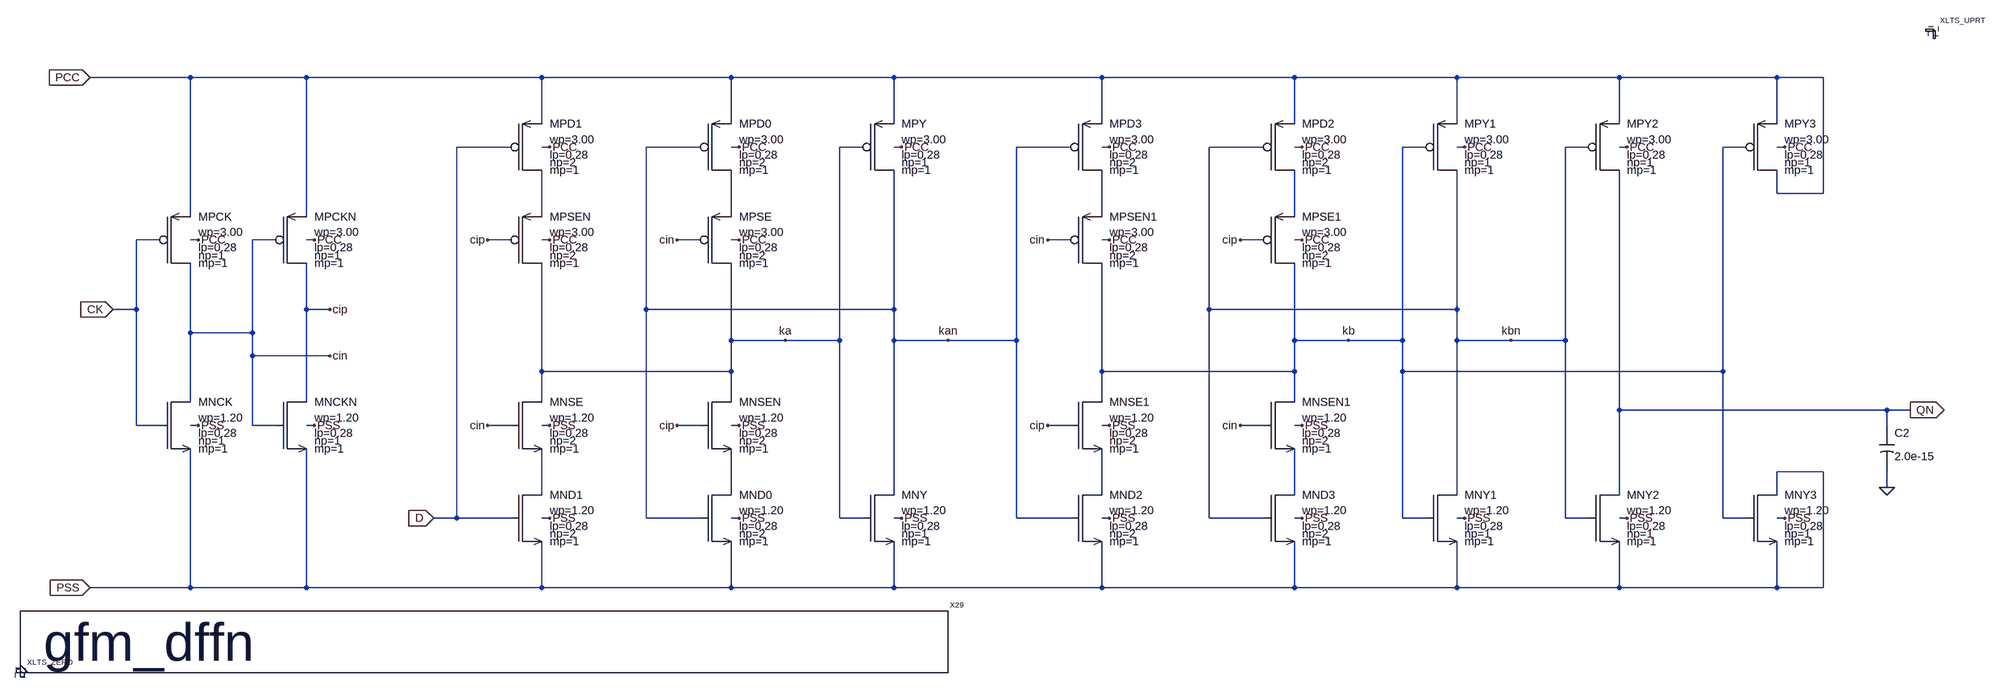
[diagram p0: schematic gfm_dffn.asc]
gfm_dffn.asc, the LTspice schematic file:
Version 4
SHEET 1 4876 4336
WIRE 352 -1232 144 -1232
WIRE 592 -1232 352 -1232
WIRE 1232 -1232 592 -1232
WIRE 1632 -1232 1232 -1232
WIRE 1968 -1232 1632 -1232
WIRE 2768 -1232 1968 -1232
WIRE 3168 -1232 2768 -1232
WIRE 3504 -1232 3168 -1232
WIRE 3840 -1232 3504 -1232
WIRE 4176 -1232 3840 -1232
WIRE 4272 -1232 4176 -1232
WIRE 1232 -1136 1232 -1232
WIRE 1632 -1136 1632 -1232
WIRE 1968 -1136 1968 -1232
WIRE 2768 -1136 2768 -1232
WIRE 3168 -1136 3168 -1232
WIRE 3504 -1136 3504 -1232
WIRE 3840 -1136 3840 -1232
WIRE 4176 -1136 4176 -1232
WIRE 1168 -1088 1056 -1088
WIRE 1248 -1088 1232 -1088
WIRE 1568 -1088 1456 -1088
WIRE 1648 -1088 1632 -1088
WIRE 1904 -1088 1856 -1088
WIRE 1984 -1088 1968 -1088
WIRE 2704 -1088 2592 -1088
WIRE 2784 -1088 2768 -1088
WIRE 3104 -1088 2992 -1088
WIRE 3184 -1088 3168 -1088
WIRE 3440 -1088 3392 -1088
WIRE 3520 -1088 3504 -1088
WIRE 3776 -1088 3728 -1088
WIRE 3856 -1088 3840 -1088
WIRE 4112 -1088 4064 -1088
WIRE 4192 -1088 4176 -1088
WIRE 4176 -992 4176 -1040
WIRE 4272 -992 4272 -1232
WIRE 4272 -992 4176 -992
WIRE 352 -944 352 -1232
WIRE 592 -944 592 -1232
WIRE 1232 -944 1232 -1040
WIRE 1632 -944 1632 -1040
WIRE 2768 -944 2768 -1040
WIRE 3168 -944 3168 -1040
WIRE 288 -896 240 -896
WIRE 368 -896 352 -896
WIRE 528 -896 480 -896
WIRE 608 -896 592 -896
WIRE 1168 -896 1120 -896
WIRE 1248 -896 1232 -896
WIRE 1568 -896 1520 -896
WIRE 1648 -896 1632 -896
WIRE 2704 -896 2656 -896
WIRE 2784 -896 2768 -896
WIRE 3104 -896 3056 -896
WIRE 3184 -896 3168 -896
WIRE 240 -752 240 -896
WIRE 240 -752 192 -752
WIRE 592 -752 592 -848
WIRE 640 -752 592 -752
WIRE 1456 -752 1456 -1088
WIRE 1968 -752 1968 -1040
WIRE 1968 -752 1456 -752
WIRE 2992 -752 2992 -1088
WIRE 3504 -752 3504 -1040
WIRE 3504 -752 2992 -752
WIRE 352 -704 352 -848
WIRE 480 -704 480 -896
WIRE 480 -704 352 -704
WIRE 1632 -688 1632 -848
WIRE 1744 -688 1632 -688
WIRE 1856 -688 1856 -1088
WIRE 1856 -688 1744 -688
WIRE 1968 -688 1968 -752
WIRE 2080 -688 1968 -688
WIRE 2592 -688 2592 -1088
WIRE 2592 -688 2080 -688
WIRE 3168 -688 3168 -848
WIRE 3280 -688 3168 -688
WIRE 3392 -688 3392 -1088
WIRE 3392 -688 3280 -688
WIRE 3504 -688 3504 -752
WIRE 3616 -688 3504 -688
WIRE 3728 -688 3728 -1088
WIRE 3728 -688 3616 -688
WIRE 480 -656 480 -704
WIRE 640 -656 480 -656
WIRE 1232 -624 1232 -848
WIRE 1632 -624 1632 -688
WIRE 1632 -624 1232 -624
WIRE 2768 -624 2768 -848
WIRE 3168 -624 3168 -688
WIRE 3168 -624 2768 -624
WIRE 3392 -624 3392 -688
WIRE 4064 -624 4064 -1088
WIRE 4064 -624 3392 -624
WIRE 352 -560 352 -704
WIRE 592 -560 592 -752
WIRE 1232 -560 1232 -624
WIRE 1632 -560 1632 -624
WIRE 2768 -560 2768 -624
WIRE 3168 -560 3168 -624
WIRE 3840 -544 3840 -1040
WIRE 4560 -544 3840 -544
WIRE 4608 -544 4560 -544
WIRE 240 -512 240 -752
WIRE 288 -512 240 -512
WIRE 368 -512 352 -512
WIRE 480 -512 480 -656
WIRE 528 -512 480 -512
WIRE 608 -512 592 -512
WIRE 1168 -512 1120 -512
WIRE 1248 -512 1232 -512
WIRE 1568 -512 1520 -512
WIRE 1648 -512 1632 -512
WIRE 2704 -512 2656 -512
WIRE 2784 -512 2768 -512
WIRE 3104 -512 3056 -512
WIRE 3184 -512 3168 -512
WIRE 4560 -512 4560 -544
WIRE 4272 -416 4176 -416
WIRE 4560 -384 4560 -416
WIRE 1232 -368 1232 -464
WIRE 1632 -368 1632 -464
WIRE 1968 -368 1968 -688
WIRE 2768 -368 2768 -464
WIRE 3168 -368 3168 -464
WIRE 3504 -368 3504 -688
WIRE 3840 -368 3840 -544
WIRE 4176 -368 4176 -416
WIRE 1056 -320 1056 -1088
WIRE 1056 -320 1008 -320
WIRE 1168 -320 1056 -320
WIRE 1248 -320 1232 -320
WIRE 1456 -320 1456 -752
WIRE 1568 -320 1456 -320
WIRE 1648 -320 1632 -320
WIRE 1856 -320 1856 -688
WIRE 1904 -320 1856 -320
WIRE 1984 -320 1968 -320
WIRE 2592 -320 2592 -688
WIRE 2704 -320 2592 -320
WIRE 2784 -320 2768 -320
WIRE 2992 -320 2992 -752
WIRE 3104 -320 2992 -320
WIRE 3184 -320 3168 -320
WIRE 3392 -320 3392 -624
WIRE 3440 -320 3392 -320
WIRE 3520 -320 3504 -320
WIRE 3728 -320 3728 -688
WIRE 3776 -320 3728 -320
WIRE 3856 -320 3840 -320
WIRE 4064 -320 4064 -624
WIRE 4112 -320 4064 -320
WIRE 4192 -320 4176 -320
WIRE 352 -176 352 -464
WIRE 352 -176 144 -176
WIRE 592 -176 592 -464
WIRE 592 -176 352 -176
WIRE 1232 -176 1232 -272
WIRE 1232 -176 592 -176
WIRE 1632 -176 1632 -272
WIRE 1632 -176 1232 -176
WIRE 1968 -176 1968 -272
WIRE 1968 -176 1632 -176
WIRE 2768 -176 2768 -272
WIRE 2768 -176 1968 -176
WIRE 3168 -176 3168 -272
WIRE 3168 -176 2768 -176
WIRE 3504 -176 3504 -272
WIRE 3504 -176 3168 -176
WIRE 3840 -176 3840 -272
WIRE 3840 -176 3504 -176
WIRE 4176 -176 4176 -272
WIRE 4176 -176 3840 -176
WIRE 4272 -176 4272 -416
WIRE 4272 -176 4176 -176
FLAG 144 -176 PSS
IOPIN 144 -176 In
FLAG 144 -1232 PCC
IOPIN 144 -1232 In
FLAG 192 -752 CK
IOPIN 192 -752 In
FLAG 1008 -320 D
IOPIN 1008 -320 In
FLAG 1648 -512 PSS
FLAG 1520 -512 cip
FLAG 1248 -512 PSS
FLAG 1120 -512 cin
FLAG 1648 -896 PCC
FLAG 1520 -896 cin
FLAG 1248 -896 PCC
FLAG 1120 -896 cip
FLAG 1648 -1088 PCC
FLAG 1248 -1088 PCC
FLAG 1648 -320 PSS
FLAG 1248 -320 PSS
FLAG 368 -512 PSS
FLAG 368 -896 PCC
FLAG 608 -512 PSS
FLAG 608 -896 PCC
FLAG 640 -752 cip
FLAG 640 -656 cin
FLAG 1984 -1088 PCC
FLAG 1984 -320 PSS
FLAG 1744 -688 ka
FLAG 4608 -544 QN
IOPIN 4608 -544 Out
FLAG 4560 -384 0
FLAG 3184 -512 PSS
FLAG 3056 -512 cin
FLAG 2784 -512 PSS
FLAG 2656 -512 cip
FLAG 3184 -896 PCC
FLAG 3056 -896 cip
FLAG 2784 -896 PCC
FLAG 2656 -896 cin
FLAG 3184 -1088 PCC
FLAG 2784 -1088 PCC
FLAG 3184 -320 PSS
FLAG 2784 -320 PSS
FLAG 3520 -1088 PCC
FLAG 3520 -320 PSS
FLAG 3280 -688 kb
FLAG 2080 -688 kan
FLAG 3856 -1088 PCC
FLAG 3856 -320 PSS
FLAG 4192 -1088 PCC
FLAG 4192 -320 PSS
FLAG 3616 -688 kbn
SYMBOL gfmcu_nmos3p3 1168 -512 R0
SYMATTR InstName MNSE
SYMATTR SpiceLine np=2
SYMATTR Value wp=1.20
SYMATTR Value2 lp=0.28
SYMBOL gfmcu_nmos3p3 1168 -320 R0
SYMATTR InstName MND1
SYMATTR SpiceLine np=2
SYMATTR Value wp=1.20
SYMATTR Value2 lp=0.28
SYMBOL gfmcu_pmos3p3 1568 -896 R0
SYMATTR InstName MPSE
SYMATTR SpiceLine np=2
SYMATTR Value wp=3.00
SYMATTR Value2 lp=0.28
SYMBOL gfmcu_pmos3p3 1568 -1088 R0
SYMATTR InstName MPD0
SYMATTR SpiceLine np=2
SYMATTR Value wp=3.00
SYMATTR Value2 lp=0.28
SYMBOL gfmcu_pmos3p3 1168 -896 R0
SYMATTR InstName MPSEN
SYMATTR SpiceLine np=2
SYMATTR Value wp=3.00
SYMATTR Value2 lp=0.28
SYMBOL gfmcu_pmos3p3 1168 -1088 R0
SYMATTR InstName MPD1
SYMATTR SpiceLine np=2
SYMATTR Value wp=3.00
SYMATTR Value2 lp=0.28
SYMBOL BD_GTitleLTS 0 0 R0
SYMATTR InstName X29
SYMATTR SpiceModel gfm_dffn
SYMBOL gfmcu_nmos3p3 1568 -512 R0
SYMATTR InstName MNSEN
SYMATTR SpiceLine np=2
SYMATTR Value wp=1.20
SYMATTR Value2 lp=0.28
SYMBOL gfmcu_nmos3p3 1568 -320 R0
SYMATTR InstName MND0
SYMATTR SpiceLine np=2
SYMATTR Value wp=1.20
SYMATTR Value2 lp=0.28
SYMBOL gfmcu_nmos3p3 288 -512 R0
SYMATTR InstName MNCK
SYMATTR Value wp=1.20
SYMATTR Value2 lp=0.28
SYMBOL gfmcu_pmos3p3 288 -896 R0
SYMATTR InstName MPCK
SYMATTR Value wp=3.00
SYMATTR Value2 lp=0.28
SYMBOL gfmcu_nmos3p3 528 -512 R0
SYMATTR InstName MNCKN
SYMATTR Value wp=1.20
SYMATTR Value2 lp=0.28
SYMBOL gfmcu_pmos3p3 528 -896 R0
SYMATTR InstName MPCKN
SYMATTR Value wp=3.00
SYMATTR Value2 lp=0.28
SYMBOL gfmcu_pmos3p3 1904 -1088 R0
SYMATTR InstName MPY
SYMATTR Value wp=3.00
SYMATTR Value2 lp=0.28
SYMBOL gfmcu_nmos3p3 1904 -320 R0
SYMATTR InstName MNY
SYMATTR Value wp=1.20
SYMATTR Value2 lp=0.28
SYMBOL gfmcu_nmos3p3 2704 -512 R0
SYMATTR InstName MNSE1
SYMATTR SpiceLine np=2
SYMATTR Value wp=1.20
SYMATTR Value2 lp=0.28
SYMBOL gfmcu_nmos3p3 2704 -320 R0
SYMATTR InstName MND2
SYMATTR SpiceLine np=2
SYMATTR Value wp=1.20
SYMATTR Value2 lp=0.28
SYMBOL gcap 4560 -512 R0
SYMATTR InstName C2
SYMATTR Value 2.0e-15
SYMBOL gfmcu_pmos3p3 3104 -896 R0
SYMATTR InstName MPSE1
SYMATTR SpiceLine np=2
SYMATTR Value wp=3.00
SYMATTR Value2 lp=0.28
SYMBOL gfmcu_pmos3p3 3104 -1088 R0
SYMATTR InstName MPD2
SYMATTR SpiceLine np=2
SYMATTR Value wp=3.00
SYMATTR Value2 lp=0.28
SYMBOL gfmcu_pmos3p3 2704 -896 R0
SYMATTR InstName MPSEN1
SYMATTR SpiceLine np=2
SYMATTR Value wp=3.00
SYMATTR Value2 lp=0.28
SYMBOL gfmcu_pmos3p3 2704 -1088 R0
SYMATTR InstName MPD3
SYMATTR SpiceLine np=2
SYMATTR Value wp=3.00
SYMATTR Value2 lp=0.28
SYMBOL gfmcu_nmos3p3 3104 -512 R0
SYMATTR InstName MNSEN1
SYMATTR SpiceLine np=2
SYMATTR Value wp=1.20
SYMATTR Value2 lp=0.28
SYMBOL gfmcu_nmos3p3 3104 -320 R0
SYMATTR InstName MND3
SYMATTR SpiceLine np=2
SYMATTR Value wp=1.20
SYMATTR Value2 lp=0.28
SYMBOL gfmcu_pmos3p3 3440 -1088 R0
SYMATTR InstName MPY1
SYMATTR Value wp=3.00
SYMATTR Value2 lp=0.28
SYMBOL gfmcu_nmos3p3 3440 -320 R0
SYMATTR InstName MNY1
SYMATTR Value wp=1.20
SYMATTR Value2 lp=0.28
SYMBOL gfmcu_pmos3p3 3776 -1088 R0
SYMATTR InstName MPY2
SYMATTR Value wp=3.00
SYMATTR Value2 lp=0.28
SYMBOL gfmcu_nmos3p3 3776 -320 R0
SYMATTR InstName MNY2
SYMATTR Value wp=1.20
SYMATTR Value2 lp=0.28
SYMBOL gfmcu_pmos3p3 4112 -1088 R0
SYMATTR InstName MPY3
SYMATTR Value wp=3.00
SYMATTR Value2 lp=0.28
SYMBOL gfmcu_nmos3p3 4112 -320 R0
SYMATTR InstName MNY3
SYMATTR Value wp=1.20
SYMATTR Value2 lp=0.28
SYMBOL BD_ZERO 0 0 R0
SYMATTR InstName XLTS_ZERO
SYMBOL BD_UPRT 4656 -1328 R0
SYMATTR InstName XLTS_UPRT

The netlist it stands for:
* gfm_dffn.asc
XMNSE ka cin N005 PSS gfmcu_nmos3p3 wp=1.20 lp=0.28 np=2 mp=1  ; pins ND NG NS NB
XMND1 N005 D PSS PSS gfmcu_nmos3p3 wp=1.20 lp=0.28 np=2 mp=1  ; pins ND NG NS NB
XMPSE ka cin N002 PCC gfmcu_pmos3p3 wp=3.00 lp=0.28 np=2 mp=1  ; pins ND NG NS NB
XMPD0 N002 kan PCC PCC gfmcu_pmos3p3 wp=3.00 lp=0.28 np=2 mp=1  ; pins ND NG NS NB
XMPSEN ka cip N001 PCC gfmcu_pmos3p3 wp=3.00 lp=0.28 np=2 mp=1  ; pins ND NG NS NB
XMPD1 N001 D PCC PCC gfmcu_pmos3p3 wp=3.00 lp=0.28 np=2 mp=1  ; pins ND NG NS NB
XX29 BD_GTitleLTS
XMNSEN ka cip N006 PSS gfmcu_nmos3p3 wp=1.20 lp=0.28 np=2 mp=1  ; pins ND NG NS NB
XMND0 N006 kan PSS PSS gfmcu_nmos3p3 wp=1.20 lp=0.28 np=2 mp=1  ; pins ND NG NS NB
XMNCK cin CK PSS PSS gfmcu_nmos3p3 wp=1.20 lp=0.28 np=1 mp=1  ; pins ND NG NS NB
XMPCK cin CK PCC PCC gfmcu_pmos3p3 wp=3.00 lp=0.28 np=1 mp=1  ; pins ND NG NS NB
XMNCKN cip cin PSS PSS gfmcu_nmos3p3 wp=1.20 lp=0.28 np=1 mp=1  ; pins ND NG NS NB
XMPCKN cip cin PCC PCC gfmcu_pmos3p3 wp=3.00 lp=0.28 np=1 mp=1  ; pins ND NG NS NB
XMPY kan ka PCC PCC gfmcu_pmos3p3 wp=3.00 lp=0.28 np=1 mp=1  ; pins ND NG NS NB
XMNY kan ka PSS PSS gfmcu_nmos3p3 wp=1.20 lp=0.28 np=1 mp=1  ; pins ND NG NS NB
XMNSE1 kb cip N007 PSS gfmcu_nmos3p3 wp=1.20 lp=0.28 np=2 mp=1  ; pins ND NG NS NB
XMND2 N007 kan PSS PSS gfmcu_nmos3p3 wp=1.20 lp=0.28 np=2 mp=1  ; pins ND NG NS NB
C2 QN 0 2.0e-15
XMPSE1 kb cip N004 PCC gfmcu_pmos3p3 wp=3.00 lp=0.28 np=2 mp=1  ; pins ND NG NS NB
XMPD2 N004 kbn PCC PCC gfmcu_pmos3p3 wp=3.00 lp=0.28 np=2 mp=1  ; pins ND NG NS NB
XMPSEN1 kb cin N003 PCC gfmcu_pmos3p3 wp=3.00 lp=0.28 np=2 mp=1  ; pins ND NG NS NB
XMPD3 N003 kan PCC PCC gfmcu_pmos3p3 wp=3.00 lp=0.28 np=2 mp=1  ; pins ND NG NS NB
XMNSEN1 kb cin N008 PSS gfmcu_nmos3p3 wp=1.20 lp=0.28 np=2 mp=1  ; pins ND NG NS NB
XMND3 N008 kbn PSS PSS gfmcu_nmos3p3 wp=1.20 lp=0.28 np=2 mp=1  ; pins ND NG NS NB
XMPY1 kbn kb PCC PCC gfmcu_pmos3p3 wp=3.00 lp=0.28 np=1 mp=1  ; pins ND NG NS NB
XMNY1 kbn kb PSS PSS gfmcu_nmos3p3 wp=1.20 lp=0.28 np=1 mp=1  ; pins ND NG NS NB
XMPY2 QN kbn PCC PCC gfmcu_pmos3p3 wp=3.00 lp=0.28 np=1 mp=1  ; pins ND NG NS NB
XMNY2 QN kbn PSS PSS gfmcu_nmos3p3 wp=1.20 lp=0.28 np=1 mp=1  ; pins ND NG NS NB
XMPY3 PCC kb PCC PCC gfmcu_pmos3p3 wp=3.00 lp=0.28 np=1 mp=1  ; pins ND NG NS NB
XMNY3 PSS kb PSS PSS gfmcu_nmos3p3 wp=1.20 lp=0.28 np=1 mp=1  ; pins ND NG NS NB
XXLTS_ZERO BD_ZERO
XXLTS_UPRT BD_UPRT
.lib models_gfmcu.lib
.lib dmodels_analog.lib
.backanno
.end